# Altium schematic sheet Memory_EEPROM.SchDoc: Memory - EEPROM M24C64 (I2C4)
size A3; ApprovedBy: Weymen Koo; CheckedBy: -; DrawnBy: Weymen Koo; DocumentNumber: UBCAD-FCSOM-SCH; Revision: A; SheetNumber: 11; SheetTotal: 18; ProjectTitle: Flight Controller SoM; Status: PRELIMINARY; ReleaseDate: 2026-11-14
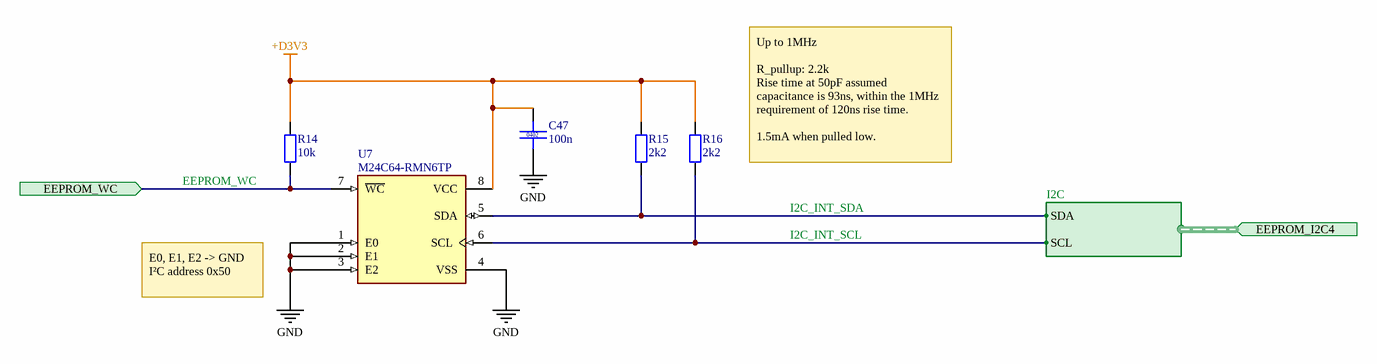
[diagram p0: Memory_EEPROM.SchDoc]

## Parts
C47  100n  [CAPC1005X05N]
R14  10k  [IPC C R0402 NO SILK]
R15  2k2  [IPC C R0402 NO SILK]
R16  2k2  [IPC C R0402 NO SILK]
U7  M24C64-RMN6TP  [SOIC127P600X175-8N]

## Ports
EEPROM_I2C4 (in, harness I2C, see 1[4B], 4[3B]), EEPROM_WC (in, see 1[4B], 4[3C])

## Harnesses
I2C: SCL, SDA

## Nets
+D3V3: C47.1 R14.2 R15.2 R16.2 U7.8(VCC)
GND: C47.2 U7.1(E0) U7.2(E1) U7.3(E2) U7.4(VSS)
EEPROM_WC: R14.1 U7.7(~{WC}) ; port EEPROM_WC
I2C_INT_SCL: R16.1 U7.6(SCL) ; port EEPROM_I2C4.SCL
I2C_INT_SDA: R15.1 U7.5(SDA) ; port EEPROM_I2C4.SDA

## Notes on the sheet
- Up to 1MHz
  R_pullup: 2.2k
  Rise time at 50pF assumed capacitance is 93ns, within the 1MHz requirement of 120ns rise time.
  1.5mA when pulled low.
- E0, E1, E2 -> GND
  I²C address 0x50
- PROJECT
- KEY
- POWER
- 5 V class
- 3.3 V class
- Core / SMPS
- GND
- SHEET TITLE
- SIGNALS
- NOTES
- SPI
- Analog
- Design
- I2C
- PWM/Timer
- Layout
- UART/RC
- GPIO/Ctrl
- Assembly
- CAN
- Unused pin
- Firmware
- USB/SD/Clk
- Critical
- DRAWN
- DOCUMENT NO.
- CHECKED
- REV
- STATUS
- APPROVED
- DATE
- FILE
- SIZE
- A3
- SHEET
- of

## Library data of the parts
C47 = CMP-002-000094-5: CAP 100n 16V X7R 10% 0402; Manufacturer: Samsung; Manufacturer Part Number: CL05B104KO5NNNC; Value: 100n; Tolerance: 10%; Package: 0402; Voltage: 16V; Dielectric: X7R; LCSC Part #: C1525
R14 = CMP-008-000000-2: RES 10k 1% 1/16W 0402; Manufacturer: UNI-ROYAL; Manufacturer Part Number: 0402WGF1002TCE; Value: 10k; Source: Schlib1.SchLib; Design Item ID: Generic RES 0402; Package: 0402; Tolerance: 1%; Power: 1/16W; LCSC Part #: C25744
R15 R16 = CMP-008-000000-2: RES 2k2 1% 1/16W 0402; Manufacturer: UNI-ROYAL; Manufacturer Part Number: 0402WGF2201TCE; Value: 2k2; Source: Schlib1.SchLib; Design Item ID: Generic RES 0402; Package: 0402; Tolerance: 1%; Power: 1/16W; LCSC Part #: C25879
U7 = CMP-057-000000-5: EEPROM Serial-I2C 64K-bit 8K x 8 2.5V/3.3V/5V 8-Pin SOIC T/R; MP: altium_native_batch; Availability: Unavailable; Pin Count: 8; Package: None; Component Type: Standard; Source: M24C64-RMN6TP.SchLib; Price: None; Design Item ID: M24C64-RMN6TP; Value: *